# EasyEDA Pro project EVA_RT.eprj, board Footprint_Rule_PCB
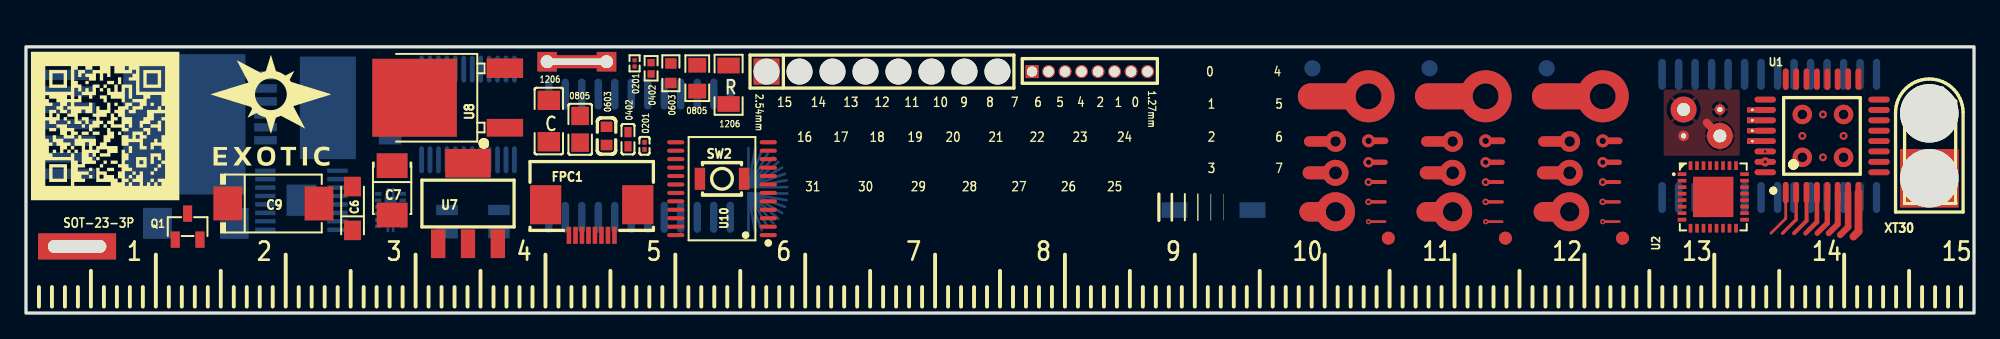
[diagram p14: board, top side]
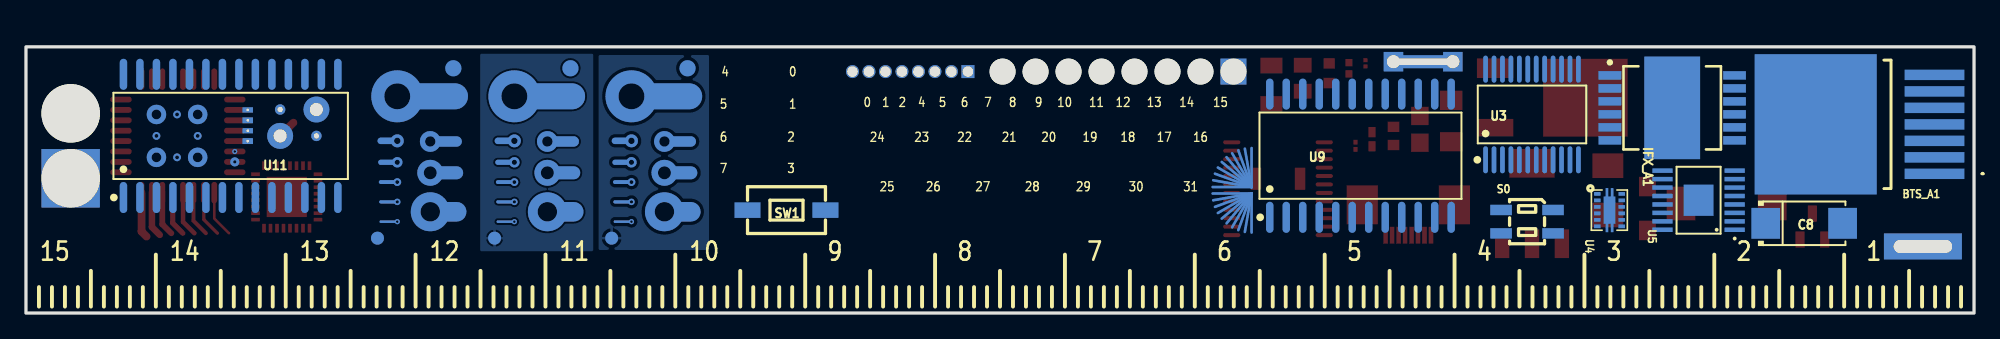
[diagram p15: board, bottom side, seen from below]

Outline 150 x 20.5 mm; copper layers: Top Layer, Bottom Layer. Coordinates in mm from the lower left corner of the outline.
Outline path: rectangle 0,20.5 150,0
Stack: Top Layer 0.035mm - / Dielectric1 1.51mm FR4 er 4.5 / Bottom Layer 0.035mm -

## Design rules (mm)
template: JLCPCB Capability(Two Layers Board)
spacing copperThickness1oz (default): track to track 0.102, other pairs 0.152 to 0.3
spacing copperThickness2oz: track to track 0.203, other pairs 0.152 to 0.3
track width copperThickness1oz (default): min 0.127, default 0.254, max 2.54
track width copperThickness2oz: min 0.203, default 0.254, max 2.54
differential pair differentialPair (default): width min 0.127, default 0.254, max 2.54; gap min 0.152, default 0.152
via viaSize (default): diameter min 0.5, default 0.61, max 10; hole min 0.3, default 0.305, max 6.3

## Placement (name value [footprint] x y rotation side)
BTS_A1  -  [BTS7960B]  12.19 14.53 90 bottom
C1  4.7uF  [C1206]  40.26 14.78 90 top
C2  4.7uF  [C0805]  42.67 14.15 90 top
C3  4.7uF  [C0603]  44.7 13.64 90 top
C4  160pF  [C0402]  46.36 13.39 90 top
C5  12pF  [C0201]  47.62 12.88 90 top
C6  47uF  [CAP-SMD_L3.2-W1.6-RD]  25.15 8.05 90 top
C7  10uF  [CAP-SMD_L3.5-W2.8-R-RD]  28.19 9.45 90 top
C8  100uF  [CAP-SMD_L6.0-W3.2-R-RD]  13.08 6.91 0 bottom
C9  100uF  [CAP-SMD_L7.3-W4.3-R-RD]  19.05 8.43 180 top
FPC1  FFC05001-08SBA124W5M  [FFC-SMD_FFC05001-08SBA124W5M]  43.56 7.16 180 top
H1  PZ254-1-08-Z-8.5  [HDR-TH_8P-P2.54-V-M]  65.91 18.59 0 top
H2  KH-1.27PH180-1X8P-L7.2  [HDR-TH_8P-P1.27-V-M]  81.91 18.59 0 top
IFX_A1  -  [PG-DSO-12-17]  23.24 15.8 180 bottom
NOREF  -  [Pad_e1069]  122.93 5.77 0 top
NOREF#2  -  [Pad_e1064]  99.06 18.85 0 top
NOREF#3  -  [Pad_e1059]  132.92 13.24 270 top
NOREF#4  -  [Pad_e1066]  108.08 18.85 0 top
NOREF#5  -  [Pad_e1067]  113.92 5.77 0 top
NOREF#6  -  [Pad_e1071]  113.92 5.77 0 top
NOREF#7  -  [Pad_e1065]  104.9 5.77 0 top
NOREF#8  -  [Pad_e1058]  132.92 14.84 270 top
NOREF#9  -  [Pad_e1051]  40.13 19.35 270 top
NOREF#10  -  [Pad_e1054]  127.63 13.64 270 top
NOREF#11  -  [Pad_e1068]  117.09 18.85 0 top
NOREF#12  -  [Pad_e1055]  127.63 15.67 90 top
NOREF#13  -  [Pad_e1050]  3.94 5.13 270 top
NOREF#14  -  [Pad_e1072]  122.93 5.77 0 top
NOREF#15  -  [Pad_e1053]  44.7 19.35 270 top
NOREF#16  -  [Pad_e1061]  132.92 14.04 270 top
NOREF#17  -  [Pad_e1060]  132.92 15.64 270 top
NOREF#18  -  [Pad_e1057]  130.43 15.67 90 top
NOREF#19  -  [Pad_e1052]  42.42 19.35 270 top
NOREF#20  -  [Pad_e1070]  104.9 5.77 0 top
NOREF#21  -  [Pad_e1056]  130.43 13.64 270 top
Q1  FDN340P  [SOT-23-3_L2.9-W1.3-P1.90-LS2.4-BR]  12.45 6.65 270 top
R1  100kΩ  [R1206]  54.1 17.58 90 top
R2  110Ω  [R0805]  51.69 18.08 90 top
R3  47Ω  [R0603]  49.66 18.47 90 top
R4  47Ω  [R0402]  48.13 18.85 270 top
R5  68.1kΩ  [R0201]  46.86 19.23 270 top
S0  QRE1113GR  [OPTO-SMD_QRE1113GR]  34.42 7.03 0 bottom
SW1  TS-1101A-C-R  [SW-SMD_L6.00-W3.60-LS6.0]  91.44 7.92 180 bottom
SW2  B3U-1000P  [KEY-SMD_B3U-1000PM]  53.59 10.34 0 top
U1  ATMEGA328P-AU  [TQFP-32_L7.0-W7.0-P0.80-LS9.0-BL]  138.3 13.64 0 top
U2  ATMEGA328P-MN  [VQFN-32_L5.0-W5.0-P0.50-TL-EP3.1]  129.92 8.94 0 top
U3  TB6612FNG(O,C,8,EL  [SSOP-24_L8.4-W5.8-P0.65-LS7.8-BL]  34.04 15.29 180 bottom
U4  DRV8835DSSR  [WSON-12_L3.0-W2.0-P0.50-BL-EP]  28.07 7.92 270 bottom
U5  DRV8833PWP  [ETSSOP-16_L5.0-W4.4-P0.65-LS6.4-BL-EP]  21.21 8.69 90 bottom
U7  AMS1117-ADJ  [SOT-223_L6.7-W3.5-P2.30-BR]  34.04 8.43 270 top
U8  78M05  [TO-252-2_L6.5-W6.1-P4.58-LS10.0-TL]  33.4 16.56 180 top
U9  CD74HC4067M  [SOIC-24_L15.4-W7.5-P1.27-LS10.3-BL]  47.24 12.11 180 bottom
U10  CD74HC4067SM96  [SSOP-24_L8.1-W5.3-P0.65-LS7.8-BL]  53.59 9.58 90 top
U11  PIC16F886-I/SO  [SOIC-28_L17.9-W7.5-P1.27-LS10.3-BL]  134.24 13.64 180 bottom
XT30  XT30UPB-M  [CONN-TH_XT30UPB-M]  146.56 12.88 270 top

## Footprints (pads in the part's own frame, mm; a bottom-side part is the same pattern mirrored in y, then rotated)
BTS7960B
  rect 0.8x4.6 smd: 1(-3.81,-9.15) 2(-2.54,-9.15) 3(-1.27,-9.15) 4(0,-9.15) 5(1.27,-9.15) 6(2.54,-9.15) 7(3.81,-9.15)
  rect 10.8x9.4 smd: 8(0,0)
C0201
  rect 0.368x0.324 smd: 1(-0.275,0) 2(0.275,0)
C0402
  rect 0.79x0.54 smd: 1(-0.545,0) 2(0.545,0)
C0603
  rect 0.8x0.9 smd: 1(-0.7,0) 2(0.7,0)
C0805
  rect 1.41x1.35 smd: 1(-1.03,0) 2(1.03,0)
C1206
  rect 1.485x1.728 smd: 1(-1.593,0) 2(1.593,0)
CAP-SMD_L3.2-W1.6-RD
  rect 1.5x1.296 smd: 1(-1.687,0) 2(1.687,0)
CAP-SMD_L3.5-W2.8-R-RD
  rect 1.9x2.376 smd: 1(1.899,0) 2(-1.899,0)
CAP-SMD_L6.0-W3.2-R-RD
  rect 2.208x2.376 smd: 1(2.961,0) 2(-2.961,0)
CAP-SMD_L7.3-W4.3-R-RD
  rect 2.208x2.592 smd: 1(3.511,0) 2(-3.511,0)
CONN-TH_XT30UPB-M
  round 4.5 hole 74.5x2.8: 1(-2.5,0)
  rect 4.5x4.5 hole 74.5x2.8: 2(2.5,0)
ETSSOP-16_L5.0-W4.4-P0.65-LS6.4-BL-EP
  rect 0.343x1.56 smd: 1(-2.275,-2.78) 2(-1.625,-2.78) 3(-0.975,-2.78) 4(-0.325,-2.78) 5(0.325,-2.78) 6(0.975,-2.78) 7(1.625,-2.78) 8(2.275,-2.78) 9(2.275,2.78) 10(1.625,2.78) 11(0.975,2.78) 12(0.325,2.78) 13(-0.325,2.78) 14(-0.975,2.78) 15(-1.625,2.78) 16(-2.275,2.78)
  rect 2.4x2.3 smd: 17(0,0)
FFC-SMD_FFC05001-08SBA124W5M
  rect 0.35x1.3 smd: 1(1.75,1.175) 2(1.25,1.175) 3(0.75,1.175) 4(0.25,1.175) 5(-0.25,1.175) 6(-0.75,1.175) 7(-1.25,1.175) 8(-1.75,1.175)
  rect 2.4x3 smd: 9(-3.55,-1.175) 10(3.55,-1.175)
HDR-TH_8P-P1.27-V-M
  rect 1x1 hole 0.8x0.6: 1(-4.445,0)
  round 1 hole 0.8x0.6: 2(-3.175,0) 3(-1.905,0) 4(-0.635,0) 5(0.635,0) 6(1.905,0) 7(3.175,0) 8(4.445,0)
HDR-TH_8P-P2.54-V-M
  rect 2x2 hole 2x0.9: 1(-8.89,0)
  round 2 hole 2x0.9: 2(-6.35,0) 3(-3.81,0) 4(-1.27,0) 5(1.27,0) 6(3.81,0) 7(6.35,0) 8(8.89,0)
KEY-SMD_B3U-1000PM
  rect 0.8x1.7 smd: 1(-1.7,0) 2(1.7,0)
OPTO-SMD_QRE1113GR
  rect 1.66x0.8 smd: 1(-2,-0.9) 2(2,-0.9) 3(2,0.9) 4(-2,0.9)
Pad_e1050
  rect 2x6 hole 1x4.5: 1(0,0)
Pad_e1051
  rect 1.5x1.5 hole 1: 3(0,0)
Pad_e1052
  rect 1x5.5 hole 0.5x5: 2(0,0)
Pad_e1053
  rect 1.5x1.5 hole 1: 3(0,0)
Pad_e1054
  round 0.8 hole 0.4: 1(0,0)
Pad_e1055
  round 2 hole 1: 1(0,0)
Pad_e1056
  round 2 hole 1: 1(0,0)
Pad_e1057
  round 0.8 hole 0.4: 1(0,0)
Pad_e1058
  rect 0.45x0.8 hole 0.2: 2(0,0)
Pad_e1059
  rect 0.45x0.8 hole 0.2: 2(0,0)
Pad_e1060
  rect 0.4x0.8 hole 0.2: 2(0,0)
Pad_e1061
  rect 0.4x0.8 hole 0.2: 2(0,0)
Pad_e1064
  round 1.25 smd far side: 33(0,0)
Pad_e1065
  round 1 smd far side: 33(0,0)
Pad_e1066
  round 1.25 smd far side: 33(0,0)
Pad_e1067
  round 1 smd far side: 33(0,0)
Pad_e1068
  round 1.25 smd far side: 33(0,0)
Pad_e1069
  round 1 smd far side: 33(0,0)
Pad_e1070
  round 1 smd: 33(0,0)
Pad_e1071
  round 1 smd: 33(0,0)
Pad_e1072
  round 1 smd: 33(0,0)
PG-DSO-12-17
  rect 1.75x0.65 smd: 1(-4.8,2.5) 2(-4.8,1.5) 3(-4.8,0.5) 4(-4.8,-0.5) 5(-4.8,-1.5) 6(-4.8,-2.5) 7(4.8,-2.5) 8(4.8,-1.5) 9(4.8,-0.5) 10(4.8,0.5) 11(4.8,1.5) 12(4.8,2.5)
  rect 4.3x7.9 smd: 13(0,0)
R0201
  rect 0.303x0.324 smd: 1(-0.241,0) 2(0.241,0)
R0402
  rect 0.566x0.54 smd: 1(-0.433,0) 2(0.433,0)
R0603
  rect 0.806x0.864 smd: 1(-0.753,0) 2(0.753,0)
R0805
  rect 1.133x1.377 smd: 1(-1,0) 2(1,0)
R1206
  rect 1.208x1.701 smd: 1(-1.479,0) 2(1.479,0)
SOIC-24_L15.4-W7.5-P1.27-LS10.3-BL
  oval 0.574x2.388 smd: 1(-6.985,-4.744) 2(-5.715,-4.744) 3(-4.445,-4.744) 4(-3.175,-4.744) 5(-1.905,-4.744) 6(-0.635,-4.744) 7(0.635,-4.744) 8(1.905,-4.744) 9(3.175,-4.744) 10(4.445,-4.744) 11(5.715,-4.744) 12(6.985,-4.744) 13(6.985,4.744) 14(5.715,4.744) 15(4.445,4.744) 16(3.175,4.744) 17(1.905,4.744) 18(0.635,4.744) 19(-0.635,4.744) 20(-1.905,4.744) 21(-3.175,4.744) 22(-4.445,4.744) 23(-5.715,4.744) 24(-6.985,4.744)
SOIC-28_L17.9-W7.5-P1.27-LS10.3-BL
  oval 0.574x2.388 smd: 1(-8.255,-4.744) 2(-6.985,-4.744) 3(-5.715,-4.744) 4(-4.445,-4.744) 5(-3.175,-4.744) 6(-1.905,-4.744) 7(-0.635,-4.744) 8(0.635,-4.744) 9(1.905,-4.744) 10(3.175,-4.744) 11(4.445,-4.744) 12(5.715,-4.744) 13(6.985,-4.744) 14(8.255,-4.744) 15(8.255,4.744) 16(6.985,4.744) 17(5.715,4.744) 18(4.445,4.744) 19(3.175,4.744) 20(1.905,4.744) 21(0.635,4.744) 22(-0.635,4.744) 23(-1.905,4.744) 24(-3.175,4.744) 25(-4.445,4.744) 26(-5.715,4.744) 27(-6.985,4.744) 28(-8.255,4.744)
SOT-23-3_L2.9-W1.3-P1.90-LS2.4-BR
  rect 1.25x0.7 smd: 1(1,-0.95) 2(1,0.95) 3(-1,0)
SOT-223_L6.7-W3.5-P2.30-BR
  rect 2.2x1.1 smd: 1(3.099,-2.3) 2(3.099,0) 3(3.099,2.3)
  rect 2.2x3.5 smd: 4(-3.099,0)
SSOP-24_L8.1-W5.3-P0.65-LS7.8-BL
  oval 0.308x1.324 smd: 1(-3.575,-3.562) 2(-2.925,-3.562) 3(-2.275,-3.562) 4(-1.625,-3.562) 5(-0.975,-3.562) 6(-0.325,-3.562) 7(0.325,-3.562) 8(0.975,-3.562) 9(1.625,-3.562) 10(2.275,-3.562) 11(2.925,-3.562) 12(3.575,-3.562) 13(3.575,3.562) 14(2.925,3.562) 15(2.275,3.562) 16(1.625,3.562) 17(0.975,3.562) 18(0.325,3.562) 19(-0.325,3.562) 20(-0.975,3.562) 21(-1.625,3.562) 22(-2.275,3.562) 23(-2.925,3.562) 24(-3.575,3.562)
SSOP-24_L8.4-W5.8-P0.65-LS7.8-BL
  oval 0.364x2.082 smd: 1(-3.575,-3.491) 2(-2.925,-3.491) 3(-2.275,-3.491) 4(-1.625,-3.491) 5(-0.975,-3.491) 6(-0.325,-3.491) 7(0.325,-3.491) 8(0.975,-3.491) 9(1.625,-3.491) 10(2.275,-3.491) 11(2.925,-3.491) 12(3.575,-3.491) 13(3.575,3.491) 14(2.925,3.491) 15(2.275,3.491) 16(1.625,3.491) 17(0.975,3.491) 18(0.325,3.491) 19(-0.325,3.491) 20(-0.975,3.491) 21(-1.625,3.491) 22(-2.275,3.491) 23(-2.925,3.491) 24(-3.575,3.491)
SW-SMD_L6.00-W3.60-LS6.0
  rect 2x1.2 smd: 1(-3,0) 2(3,0)
TO-252-2_L6.5-W6.1-P4.58-LS10.0-TL
  rect 2.8x1.35 smd: 1(-3.475,2.29)
  rect 2.8x1.5 smd: 3(-3.475,-2.29)
  rect 6.5x6 smd: 4(3.475,-0.017)
TQFP-32_L7.0-W7.0-P0.80-LS9.0-BL
  oval 0.45x1.65 smd: 1(-2.8,-4.369) 2(-2,-4.369) 3(-1.2,-4.369) 4(-0.4,-4.369) 5(0.4,-4.369) 6(1.2,-4.369) 7(2,-4.369) 8(2.8,-4.369) 17(2.8,4.369) 18(2,4.369) 19(1.2,4.369) 20(0.4,4.369) 21(-0.4,4.369) 22(-1.2,4.369) 23(-2,4.369) 24(-2.8,4.369)
  oval 1.65x0.45 smd: 9(4.381,-2.8) 10(4.381,-2) 11(4.381,-1.2) 12(4.381,-0.4) 13(4.381,0.4) 14(4.381,1.2) 15(4.381,2) 16(4.381,2.8) 25(-4.381,2.8) 26(-4.381,2) 27(-4.381,1.2) 28(-4.381,0.4) 29(-4.381,-0.4) 30(-4.381,-1.2) 31(-4.381,-2) 32(-4.381,-2.8)
VQFN-32_L5.0-W5.0-P0.50-TL-EP3.1
  rect 0.665x0.28 smd: 1(-2.408,1.75) 2(-2.408,1.25) 3(-2.408,0.75) 4(-2.408,0.25) 5(-2.408,-0.25) 6(-2.408,-0.75) 7(-2.408,-1.25) 8(-2.408,-1.75) 17(2.408,-1.75) 18(2.408,-1.25) 19(2.408,-0.75) 20(2.408,-0.25) 21(2.408,0.25) 22(2.408,0.75) 23(2.408,1.25) 24(2.408,1.75)
  rect 0.28x0.665 smd: 9(-1.75,-2.408) 10(-1.25,-2.408) 11(-0.75,-2.408) 12(-0.25,-2.408) 13(0.25,-2.408) 14(0.75,-2.408) 15(1.25,-2.408) 16(1.75,-2.408) 25(1.75,2.408) 26(1.25,2.408) 27(0.75,2.408) 28(0.25,2.408) 29(-0.25,2.408) 30(-0.75,2.408) 31(-1.25,2.408) 32(-1.75,2.408)
  rect 3.1x3.1 smd: 33(0,0)
WSON-12_L3.0-W2.0-P0.50-BL-EP
  rect 0.28x0.5 smd: 1(-1.25,-0.94) 2(-0.75,-0.94) 3(-0.25,-0.94) 4(0.25,-0.94) 5(0.75,-0.94) 6(1.25,-0.94) 7(1.25,0.94) 8(0.75,0.94) 9(0.25,0.94) 10(-0.25,0.94) 11(-0.75,0.94) 12(-1.25,0.94)
  custom 3.4x0.9 smd: 13(0,0)

## Nets
GND: NOREF.33 NOREF#2.33 NOREF#4.33 NOREF#5.33 NOREF#6.33 NOREF#7.33 NOREF#10.1 NOREF#11.33 NOREF#12.1 NOREF#14.33 NOREF#18.1 NOREF#20.33 NOREF#21.1

Pads without a net: BTS_A1 1 2 3 4 5 6 7 8; C1 1 2; C2 1 2; C3 1 2; C4 1 2; C5 1 2; C6 1 2; C7 1 2; C8 1 2; C9 1 2; FPC1 1 2 3 4 5 6 7 8 9 10; H1 1 2 3 4 5 6 7 8; H2 1 2 3 4 5 6 7 8; IFX_A1 1 2 3 4 5 6 7 8 9 10 11 12 13; NOREF#3 2; NOREF#8 2; NOREF#9 3; NOREF#13 1; NOREF#15 3; NOREF#16 2; NOREF#17 2; NOREF#19 2; Q1 1 2 3; R1 1 2; R2 1 2; R3 1 2; R4 1 2; R5 1 2; S0 1 2 3 4; SW1 1 2; SW2 1 2; U1 1 2 3 4 5 6 7 8 9 10 11 12 13 14 15 16 17 18 19 20 21 22 23 24 25 26 27 28 29 30 31 32; U2 1 2 3 4 5 6 7 8 9 10 11 12 13 14 15 16 17 18 19 20 21 22 23 24 25 26 27 28 29 30 31 32 33; U3 1 2 3 4 5 6 7 8 9 10 11 12 13 14 15 16 17 18 19 20 21 22 23 24; U4 1 2 3 4 5 6 7 8 9 10 11 12 13; U5 1 2 3 4 5 6 7 8 9 10 11 12 13 14 15 16 17; U7 1 2 3 4; U8 1 3 4; U9 1 2 3 4 5 6 7 8 9 10 11 12 13 14 15 16 17 18 19 20 21 22 23 24; U10 1 2 3 4 5 6 7 8 9 10 11 12 13 14 15 16 17 18 19 20 21 22 23 24; U11 1 2 3 4 5 6 7 8 9 10 11 12 13 14 15 16 17 18 19 20 21 22 23 24 25 26 27 28; XT30 1 2

## Via types
v1: diameter 2, hole 1, Top Layer to Bottom Layer, 3 vias
v2: diameter 1.5, hole 0.75, Top Layer to Bottom Layer, 4 vias
v3: diameter 1.6, hole 0.8, Top Layer to Bottom Layer, 3 vias
v4: diameter 0.7, hole 0.25, Top Layer to Bottom Layer, 1 via
v5: diameter 0.4, hole 0.2, Top Layer to Bottom Layer, 4 vias
v6: diameter 3, hole 1.5, Top Layer to Bottom Layer, 3 vias
v7: diameter 0.6, hole 0.3, Top Layer to Bottom Layer, 7 vias
v8: diameter 0.5, hole 0.25, Top Layer to Bottom Layer, 3 vias
v9: diameter 0.8, hole 0.4, Top Layer to Bottom Layer, 3 vias
v10: diameter 4, hole 2, Top Layer to Bottom Layer, 3 vias
v11: diameter 1, hole 0.5, Top Layer to Bottom Layer, 3 vias

## Routing (per net, layer and track width the routed paths; a pad name or vN(x,y) marks a point on that pad's centre or on a via; arc(x,y) is an arc through that point)
GND: length 1.4
  Top Layer w0.6: NOREF#21.1 129.41,14.66
(no net): length 129.4
  Top Layer w0.2: v5(103.38,7.03) 104.65,7.03 ; 134.37,6.15 135.5,7.28 U1.1 ; v5(121.41,7.03) 122.68,7.03 ; v5(112.39,7.03) 113.66,7.03
  Top Layer w0.25: U1.2 136.3,7.19 135.25,6.15 ; v8(112.39,8.56) 113.66,8.56 ; v8(103.38,8.56) 104.65,8.56 ; v8(121.41,8.56) 122.68,8.56
  Top Layer w0.3: U1.3 137.1,7.11 136.14,6.15 ; v7(103.38,10.08) 104.65,10.08 ; v7(112.39,10.08) 113.66,10.08 ; v7(121.41,10.08) 122.68,10.08
  Top Layer w0.35: 137.03,6.15 137.9,7.02 U1.4
  Top Layer w0.4: 137.92,6.15 138.7,6.93 U1.5 ; v9(112.39,11.61) 113.66,11.61 ; v9(121.41,11.61) 122.68,11.61 ; v9(103.38,11.61) 104.65,11.61
  Top Layer w0.45: 138.81,6.15 139.5,6.84 U1.6
  Top Layer w0.5: v11(112.39,13.26) 113.66,13.26 ; 139.7,6.02 140.3,6.62 U1.7 ; v11(121.41,13.26) 122.68,13.26 ; v11(103.38,13.26) 104.65,13.26
  Top Layer w0.6: U1.8 141.1,6.28 140.72,5.89
  Top Layer w0.8: v3(109.85,13.21) 107.82,13.21 ; v3(100.84,13.21) 98.81,13.21 ; v3(118.87,13.21) 116.84,13.21
  Top Layer w1: v1(118.87,10.8) 116.84,10.8 ; v1(100.84,10.8) 98.81,10.8 ; v1(109.85,10.8) 107.82,10.8
  Top Layer w1.5: v6(109.85,7.8) 107.82,7.8 ; v6(118.87,7.8) 116.84,7.8 ; v6(100.84,7.8) 98.81,7.8
  Top Layer w2: v10(103.38,16.69) 98.93,16.69 ; v10(121.41,16.69) 116.97,16.69 ; v10(112.39,16.69) 107.95,16.69
  Bottom Layer w0.2: v5(103.38,7.03) 104.65,7.03 ; v5(112.39,7.03) 113.66,7.03 ; v5(121.41,7.03) 122.68,7.03
  Bottom Layer w0.25: v8(112.39,8.56) 113.66,8.56 ; v8(121.41,8.56) 122.68,8.56 ; v8(103.38,8.56) 104.65,8.56
  Bottom Layer w0.3: v7(112.39,10.08) 113.66,10.08 ; v7(121.41,10.08) 122.68,10.08 ; v7(103.38,10.08) 104.65,10.08
  Bottom Layer w0.4: v9(121.41,11.61) 122.68,11.61 ; v9(112.39,11.61) 113.66,11.61 ; v9(103.38,11.61) 104.65,11.61
  Bottom Layer w0.5: v11(112.39,13.26) 113.66,13.26 ; v11(103.38,13.26) 104.65,13.26 ; v11(121.41,13.26) 122.68,13.26
  Bottom Layer w0.8: v3(100.84,13.21) 98.81,13.21 ; v3(109.85,13.21) 107.82,13.21 ; v3(118.87,13.21) 116.84,13.21
  Bottom Layer w1: v1(118.87,10.8) 116.84,10.8 ; v1(100.84,10.8) 98.81,10.8 ; v1(109.85,10.8) 107.82,10.8
  Bottom Layer w1.5: v6(100.84,7.8) 98.81,7.8 ; v6(118.87,7.8) 116.84,7.8 ; v6(109.85,7.8) 107.82,7.8
  Bottom Layer w2: v10(112.39,16.69) 107.95,16.69 ; v10(121.41,16.69) 116.97,16.69 ; v10(103.38,16.69) 98.93,16.69
  vias: v2(136.78,15.29) v2(136.78,11.99) v2(139.95,15.29) v2(139.95,11.99) v4(133.92,11.64) v5(133.92,12.44) v7(136.78,13.64) v7(138.37,15.29) v7(138.37,11.99) v7(139.95,13.64)

## Copper pours and planes (outline as drawn; the poured copper is in the pictures)
GND on Top Layer: 126.11,17.19 131.95,17.19 131.95,12.11 126.11,12.11
GND on Bottom Layer: 106.43,19.86 114.93,19.86 114.93,4.86 106.43,4.86
GND on Bottom Layer: 97.41,19.86 105.91,19.86 105.91,4.86 97.41,4.86
GND on Bottom Layer: 115.44,19.86 123.94,19.86 123.94,4.86 115.44,4.86

## Text on the board
Bottom Silkscreen Layer: 31 | 30 | 29 | 28 | 27 | 16 | 17 | 18 | 19 | 20 | 21 | 22 | 23 | 24 | 0 | 1 | 2 | 3 | 4 | 5 | 6 | 7 | 15 | 14 | 13 | 12 | 11 | 10 | 9 | 8 | 26 | 25
Top Silkscreen Layer: 0603 | 0402 | 0201 | 1206 | 0805 | 2.54mm | 1.27mm | SOT-23-3P | 15 | 14 | 13 | 12 | 11 | 10 | 9 | 8 | 7 | 6 | 5 | 26 | 4 | 2 | 25 | 1 | 0 | 3 | 16 | 17 | 18 | 19 | 20 | 21 | 22 | 23 | 24 | 31 | 30 | 29 | 28 | 27 | C | R
